# Altium schematic sheet Cover page.SchDoc
size Letter; SheetNumber: 1; SheetTotal: 7
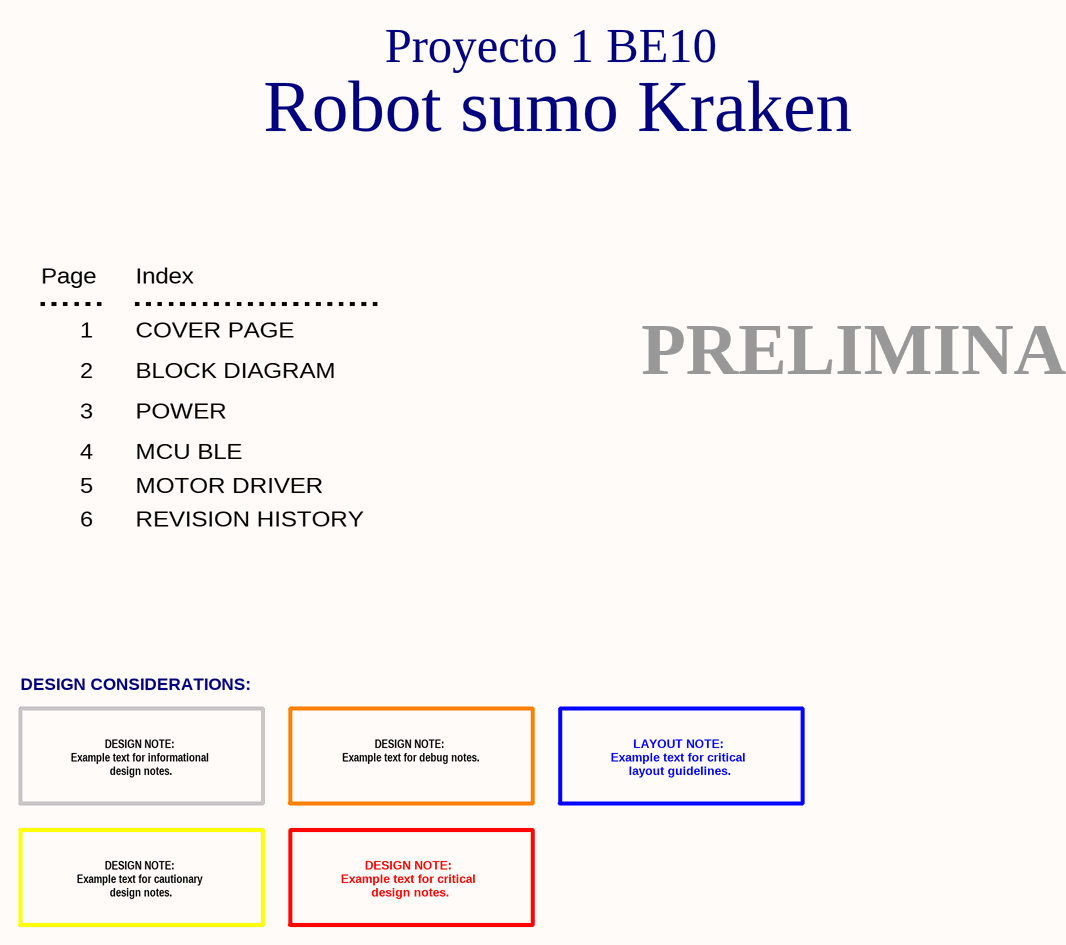
[diagram p0: Cover page.SchDoc]

## Notes on the sheet
- Proyecto 1 BE10
- Robot sumo Kraken
- Page
- Index
- 1
- COVER PAGE
- 2
- 3
- BLOCK DIAGRAM
- POWER
- PRELIMINAR
- 4
- 5
- MCU BLE
- MOTOR DRIVER
- 6
- REVISION HISTORY
- DESIGN CONSIDERATIONS:
- DESIGN NOTE:
  Example text for informational
  design notes.
- DESIGN NOTE:
  Example text for debug notes.
- LAYOUT NOTE:
  Example text for critical
  layout guidelines.
- DESIGN NOTE:
  Example text for cautionary
  design notes.
- DESIGN NOTE:
  Example text for critical
  design notes.
- Proyecto:
- Autor:
- Carné:
- Documento:
- Curso:
- Revision:
- Fecha:
- Tamaño:
- Carta
- Hoja:      de